# EAGLE design ESP8266 4-relay board 12V power (EAGLE 9.6.2)

## Sheet 1 of 3
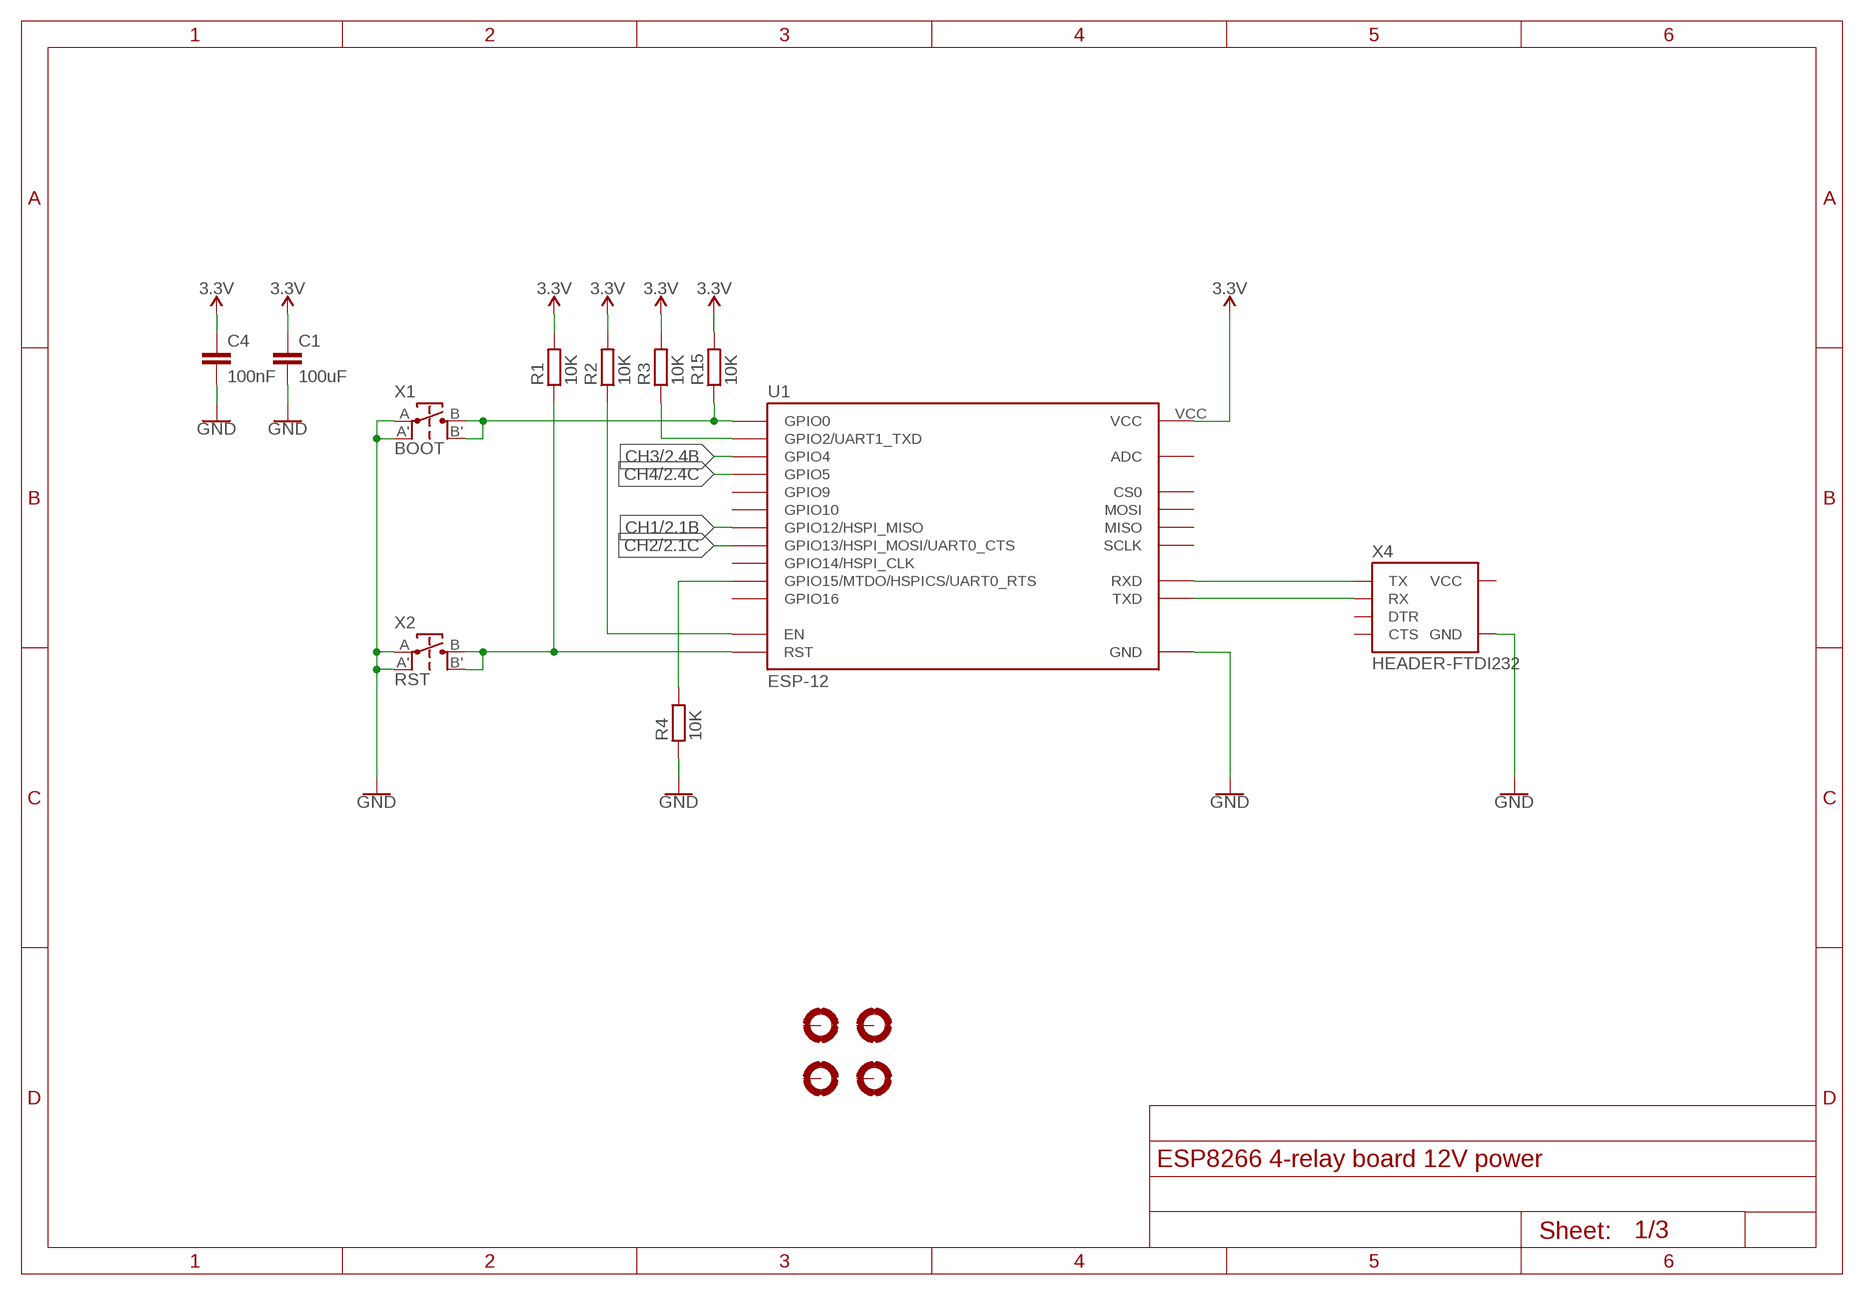
[diagram p0: schematic, sheet 1]

### Parts
C1  100uF  CAPC0603  [C0603]
C4  100nF  CAPC0603  [C0603]
H1  MOUNTHOLE-PAD3.2  [3.2-PAD]
H2  MOUNTHOLE-PAD3.2  [3.2-PAD]
H3  MOUNTHOLE-PAD3.2  [3.2-PAD]
H4  MOUNTHOLE-PAD3.2  [3.2-PAD]
R1  10K  RESISTOR0603  [R0603]
R2  10K  RESISTOR0603  [R0603]
R3  10K  RESISTOR0603  [R0603]
R4  10K  RESISTOR0603  [R0603]
R15  10K  RESISTOR0603  [R0603]
U1  ESP-12  ESP-12E  [ESP-12E]
X1  BOOT  TACT-SWITCHEVQ  [TACT-SWITCH-EVQ]
X2  RST  TACT-SWITCHEVQ  [TACT-SWITCH-EVQ]
X4  HEADER-FTDI232  [FTDI232-1X06]

### Nets
3.3V: C1.1 C4.1 R1.2 R2.2 R3.2 R15.2 U1.VCC ; also sheet 3
CH1: U1.GPIO12(GPIO12/HSPI_MISO) ; also sheet 2
CH2: U1.GPIO13(GPIO13/HSPI_MOSI/UART0_CTS) ; also sheet 2
CH3: U1.GPIO4 ; also sheet 2
CH4: U1.GPIO5 ; also sheet 2
GND: C1.2 C4.2 R4.1 U1.GND X1.A X1.A' X2.A X2.A' X4.GND ; also sheet 2,3
N$7: R4.2 U1.GPIO15(GPIO15/MTDO/HSPICS/UART0_RTS)
N$16: R2.1 U1.EN
N$19: R1.1 U1.RST X2.B X2.B'
N$22: R15.1 U1.GPIO0 X1.B X1.B'
N$24: R3.1 U1.GPIO2(GPIO2/UART1_TXD)
RXD: U1.RXD X4.TX
TXD: U1.TXD X4.RX
Unconnected: H1.B3,2(MOUNT) H2.B3,2(MOUNT) H3.B3,2(MOUNT) H4.B3,2(MOUNT) U1.ADC U1.CS0 U1.GPIO9 U1.GPIO10 U1.GPIO14(GPIO14/HSPI_CLK) U1.GPIO16 U1.MISO U1.MOSI U1.SCLK X4.CTS X4.DTR

## Sheet 2 of 3
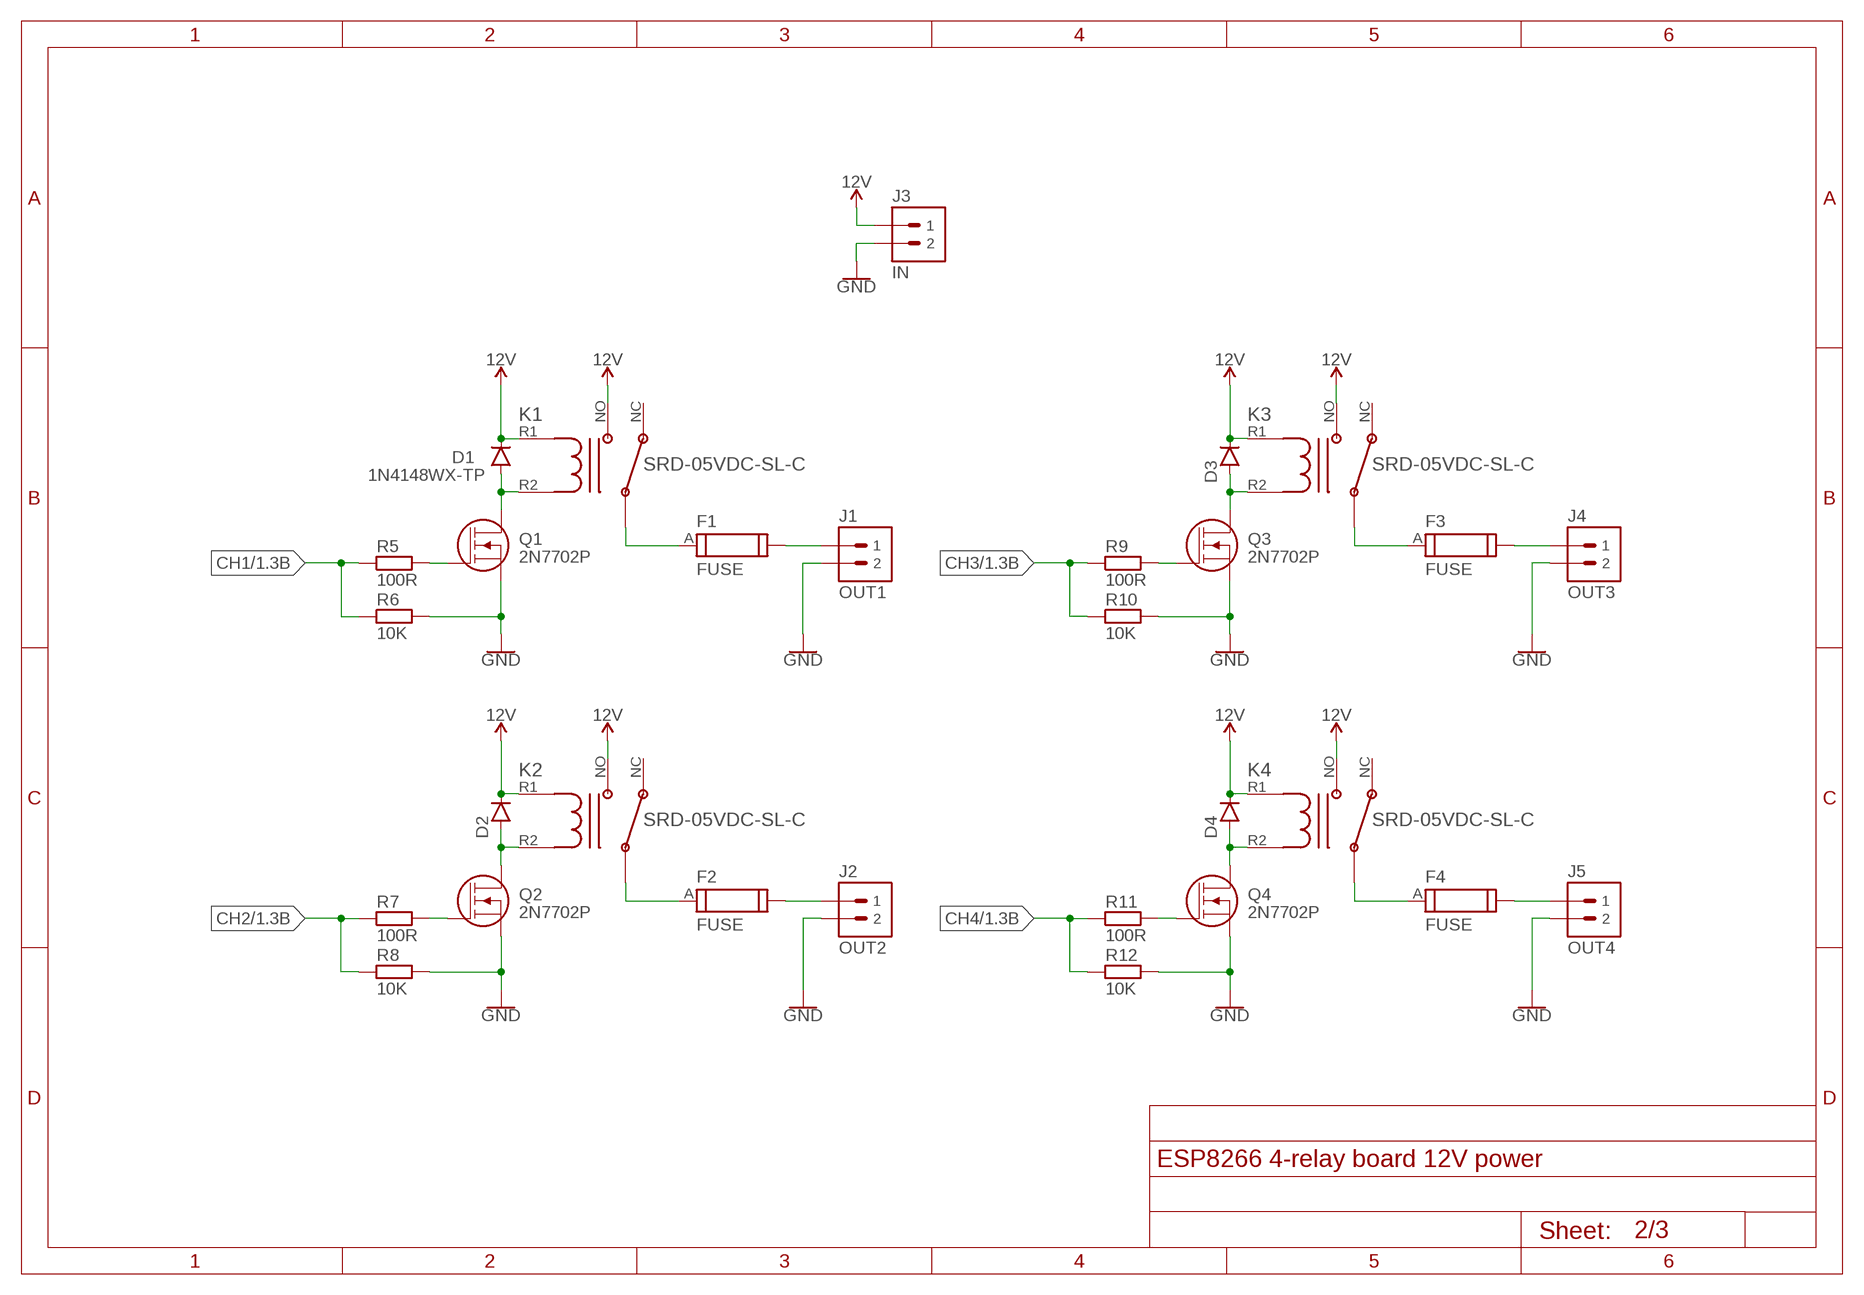
[diagram p1: schematic, sheet 2]

### Parts
D1  1N4148WX-TP  DIODE1N4148WX-TP  [SOD-323]
D2  DIODE1N4148WX-TP  [SOD-323]
D3  DIODE1N4148WX-TP  [SOD-323]
D4  DIODE1N4148WX-TP  [SOD-323]
F1  FUSE  FUSETEAL  [FUSE-TEAL]
F2  FUSE  FUSETEAL  [FUSE-TEAL]
F3  FUSE  FUSETEAL  [FUSE-TEAL]
F4  FUSE  FUSETEAL  [FUSE-TEAL]
J1  OUT1  TERMINAL-1X02-5.08OSTTC022162  [ONSHORE-OSTTC022162]
J2  OUT2  TERMINAL-1X02-5.08OSTTC022162  [ONSHORE-OSTTC022162]
J3  IN  TERMINAL-1X02-5.08OSTTC022162  [ONSHORE-OSTTC022162]
J4  OUT3  TERMINAL-1X02-5.08OSTTC022162  [ONSHORE-OSTTC022162]
J5  OUT4  TERMINAL-1X02-5.08OSTTC022162  [ONSHORE-OSTTC022162]
K1  SRD-05VDC-SL-C  RELAYSRD-05VDC-SL-C  [RELAY-SRD-05VDC-SL-C]
K2  SRD-05VDC-SL-C  RELAYSRD-05VDC-SL-C  [RELAY-SRD-05VDC-SL-C]
K3  SRD-05VDC-SL-C  RELAYSRD-05VDC-SL-C  [RELAY-SRD-05VDC-SL-C]
K4  SRD-05VDC-SL-C  RELAYSRD-05VDC-SL-C  [RELAY-SRD-05VDC-SL-C]
Q1  2N7702P  MOSFET-NCHSOT23-3  [SOT23-3]
Q2  2N7702P  MOSFET-NCHSOT23-3  [SOT23-3]
Q3  2N7702P  MOSFET-NCHSOT23-3  [SOT23-3]
Q4  2N7702P  MOSFET-NCHSOT23-3  [SOT23-3]
R5  100R  RESISTOR0603  [R0603]
R6  10K  RESISTOR0603  [R0603]
R7  100R  RESISTOR0603  [R0603]
R8  10K  RESISTOR0603  [R0603]
R9  100R  RESISTOR0603  [R0603]
R10  10K  RESISTOR0603  [R0603]
R11  100R  RESISTOR0603  [R0603]
R12  10K  RESISTOR0603  [R0603]

### Nets
12V: D1.1(C) D2.1(C) D3.1(C) D4.1(C) J3.1 K1.NO K1.R1 K2.NO K2.R1 K3.NO K3.R1 K4.NO K4.R1 ; also sheet 3
CH1: R5.1 R6.1 ; also sheet 1
CH2: R7.1 R8.1 ; also sheet 1
CH3: R9.1 R10.1 ; also sheet 1
CH4: R11.1 R12.1 ; also sheet 1
GND: J1.2 J2.2 J3.2 J4.2 J5.2 Q1.2(S) Q2.2(S) Q3.2(S) Q4.2(S) R6.2 R8.2 R10.2 R12.2 ; also sheet 1,3
N$1: D1.2(A) K1.R2 Q1.3(D)
N$2: F1.A K1.C
N$3: F1.B J1.1
N$4: Q1.1(G) R5.2
N$8: D2.2(A) K2.R2 Q2.3(D)
N$9: Q2.1(G) R7.2
N$10: F2.A K2.C
N$11: F2.B J2.1
N$12: D3.2(A) K3.R2 Q3.3(D)
N$13: F3.A K3.C
N$14: F3.B J4.1
N$15: Q3.1(G) R9.2
N$17: D4.2(A) K4.R2 Q4.3(D)
N$18: Q4.1(G) R11.2
N$20: F4.A K4.C
N$21: F4.B J5.1
Unconnected: K1.NC K2.NC K3.NC K4.NC

## Sheet 3 of 3
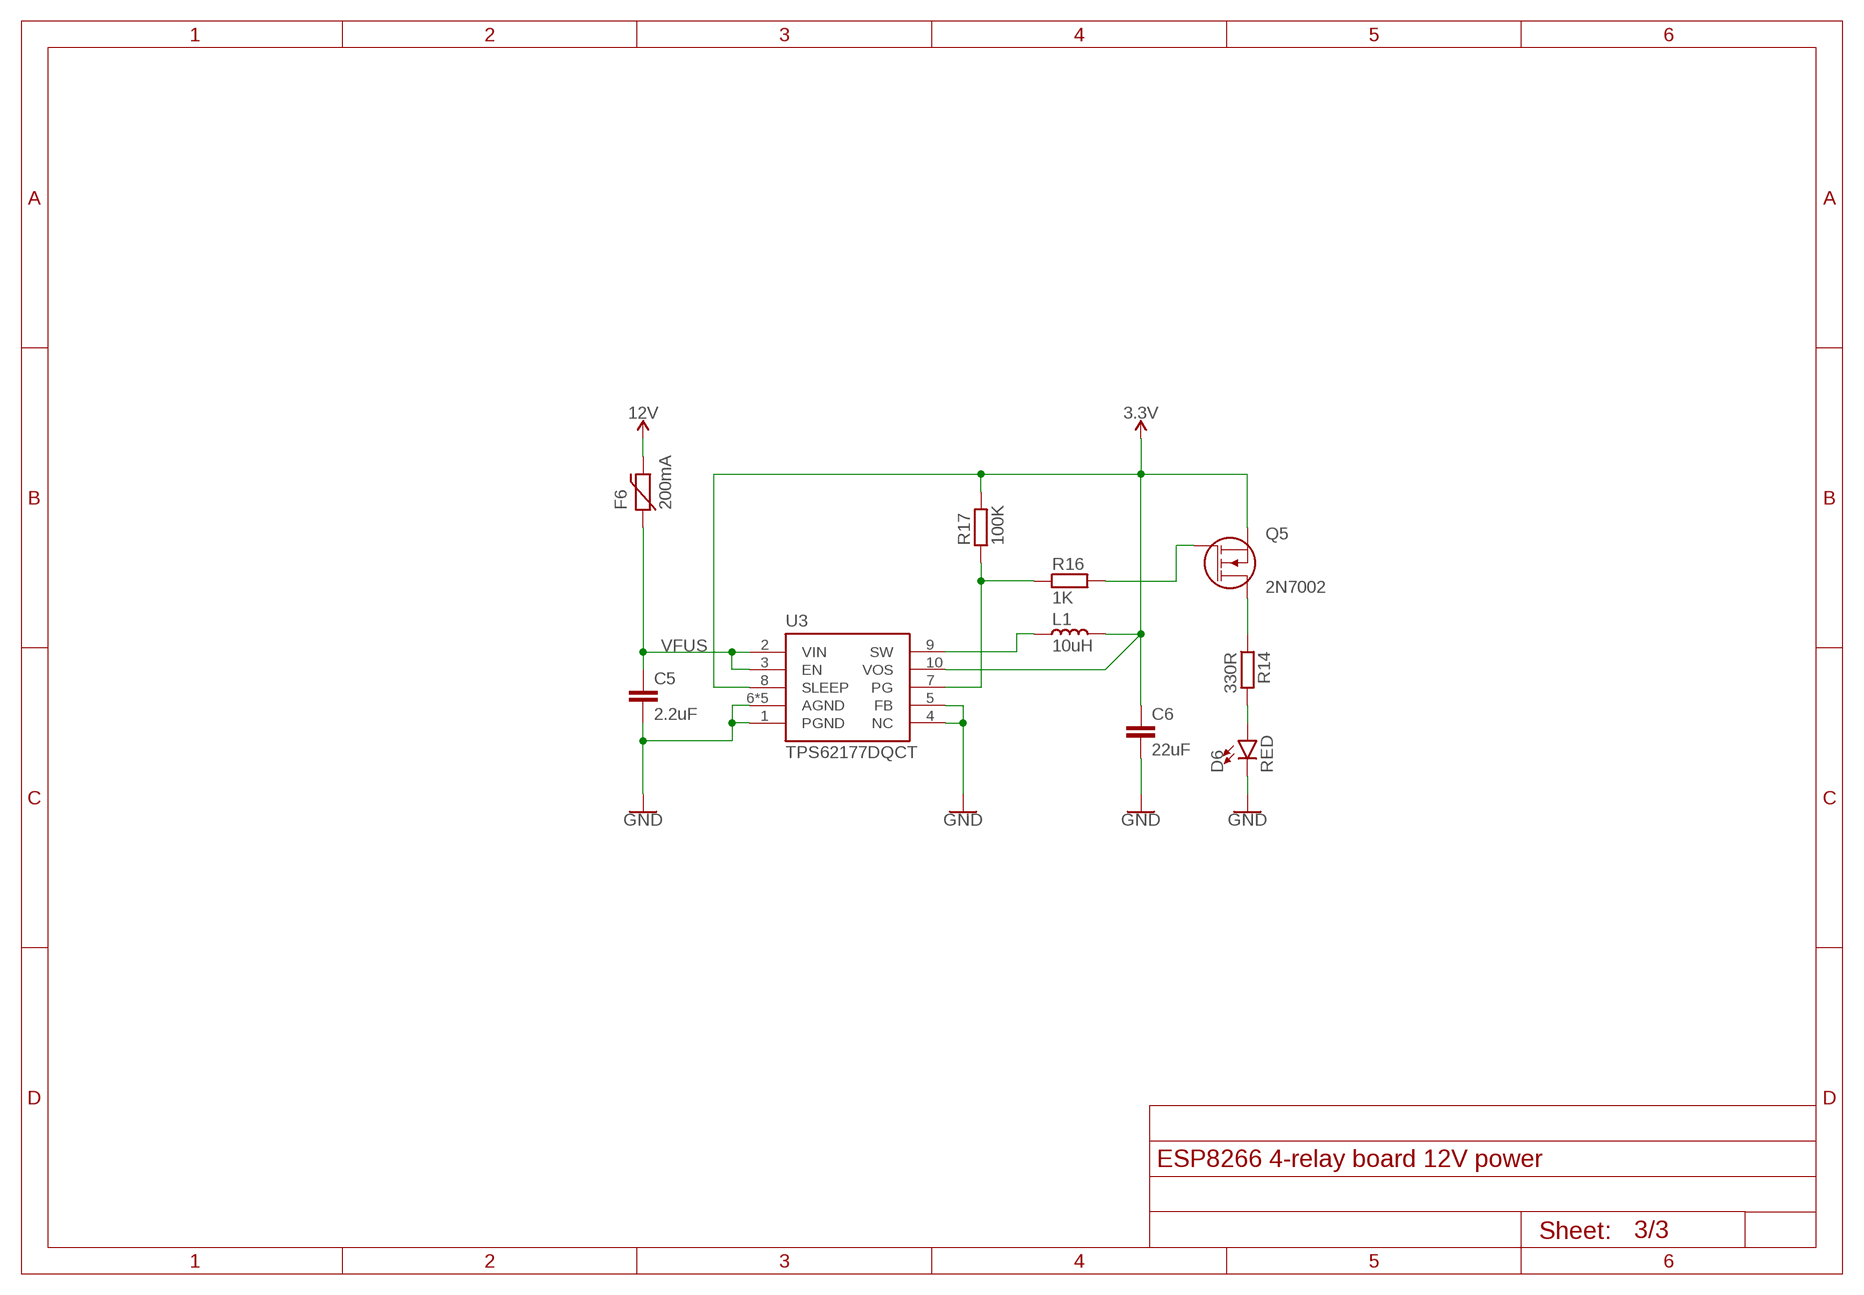
[diagram p2: schematic, sheet 3]

### Parts
C5  2.2uF  CAPC0603  [C0603]
C6  22uF  CAPC0603  [C0603]
D6  RED  LED0603  [LED0603]
F6  200mA  PTC0ZCJ  [PTC-0ZCJ-1206]
L1  10uH  INDUCTORVLS3015E  [TDK-VLS3015E]
Q5  2N7002  MOSFET-NCHSOT23-3  [SOT23-3]
R14  330R  RESISTOR0603  [R0603]
R16  1K  RESISTOR0603  [R0603]
R17  100K  RESISTOR0603  [R0603]
U3  TPS62177DQCT  TI-TPS62177DQCT  [WSON-10]

### Nets
3.3V: C6.1 L1.2 Q5.2(S) R17.2 U3.8(SLEEP) U3.10(VOS) ; also sheet 1
12V: F6.2 ; also sheet 2
GND: C5.2 C6.2 D6.C U3.1(PGND) U3.4(NC) U3.5(FB) U3.6(AGND) U3.11(AGND) U3.P$1(AGND) U3.P$2(AGND) U3.P$3(AGND) ; also sheet 1,2
N$23: D6.A R14.2
N$25: R16.1 R17.1 U3.7(PG)
N$26: Q5.1(G) R16.2
N$27: Q5.3(D) R14.1
SW1: L1.1 U3.9(SW)
VFUS: C5.1 F6.1 U3.2(VIN) U3.3(EN)

## Power pins joined to a net without a drawn wire
VCC: X4.VCC

## Library data of the parts
C1 C4-C6 = M2M-Passives:CAP
D1-D4 = M2M-DiscreteSemi:DIODE
D6 = M2M-LED:LED: LED (Generic) Standard schematic elements and footprints for 5mm, 3mm, 1206, and 0603 sized LEDs. Generic LEDs with no color specified.
F1-F4 = M2M-Power:FUSE
F6 = M2M-Fuse:PTC
H1-H4 = M2M-Holes:MOUNTHOLE-PAD
J1-J5 = M2M-Connectors:TERMINAL-1X02-5.08: https://www.digikey.se/product-detail/sv/on-shore-technology-inc/OSTTC022162/ED2609-ND/614558
K1-K4 = M2M-Switches:RELAY
L1 = M2M-Passives:INDUCTOR
Q1-Q5 = M2M-DiscreteSemi:MOSFET-NCH
R1-R12 R14-R17 = M2M-Passives:RESISTOR
U1 = M2M-Modules:ESP-12E
U3 = M2M-IC:TI-TPS62177DQCT
X1 X2 = M2M-Switches:TACT-SWITCH
X4 = M2M-Connectors:HEADER-FTDI232

## Board
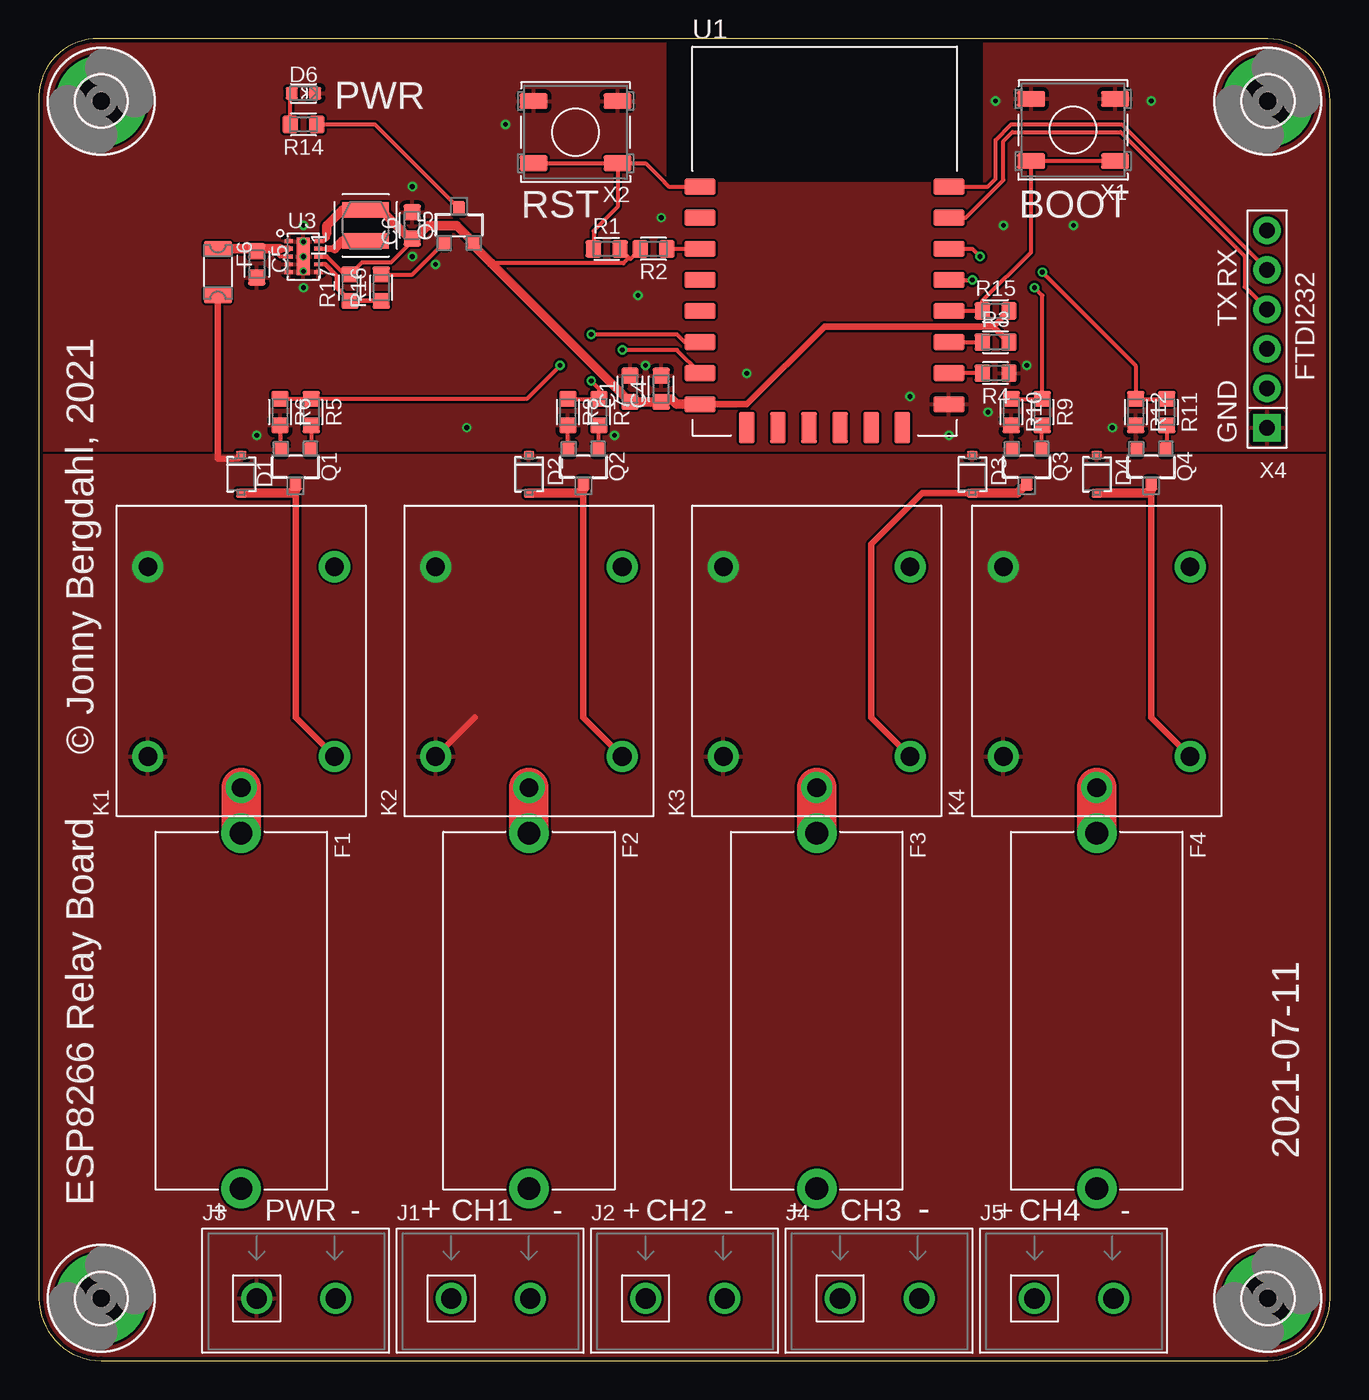
[diagram p3: board, top side]
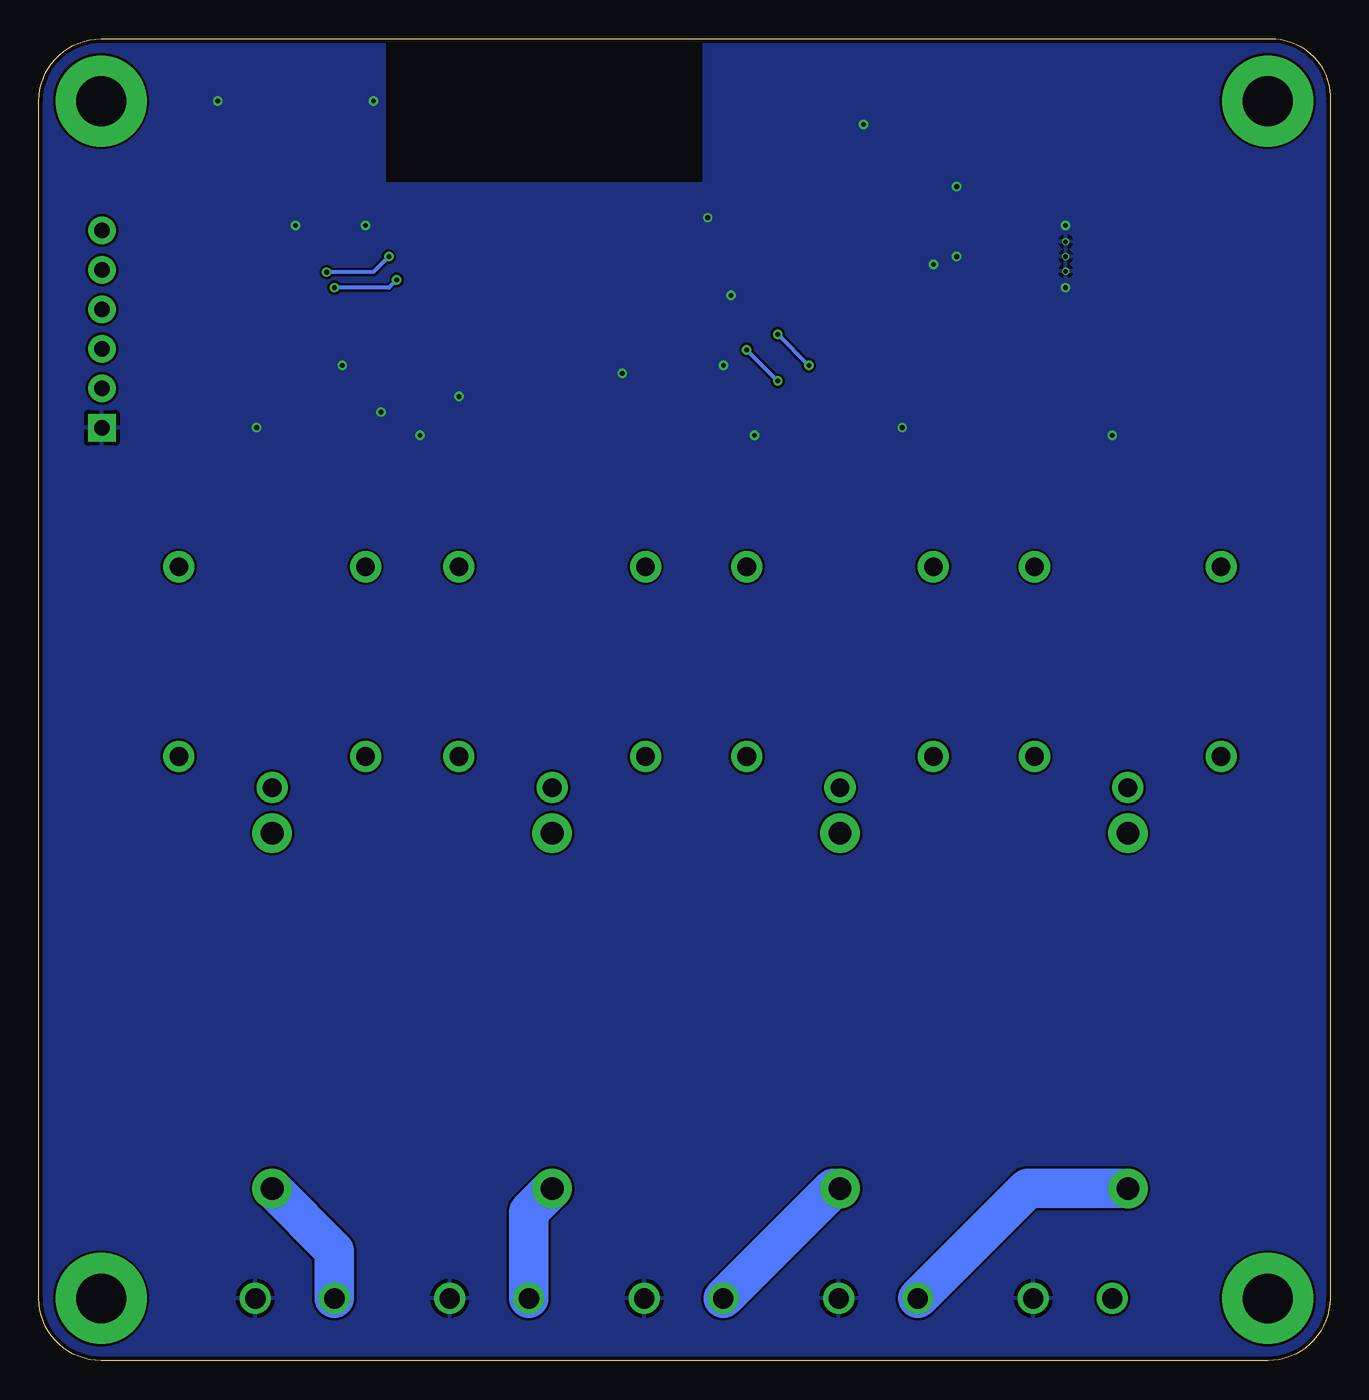
[diagram p4: board, bottom side, seen from below]

Size 83.01 x 85 mm. Coordinates in mm from the lower left corner, seen from the top.
Outline: 83.01,4 83.01,81 arc90 79.01,85 3.51,85 arc90 0.01,81 0.01,4 arc90 4.01,0 79.01,0 arc90 83.01,4
Copper layers (1*16): Top 0.035mm / dielectric 1.5mm / Bottom 0.035mm
Design rules "SeeedStudio_2layer_DRU_no_angle_20140221 *": minimum track width 6mil, minimum drill 0.3mm, track to track 6mil, track to pad 6mil, pad to pad 6mil, via to via 6mil, smd to smd 0mil, copper to edge 10mil, drill to drill 10mil, minimum pad ring 2mil, minimum via ring 6mil, stop-mask expansion 2mil, vias tented up to drill 1000mil, thermal gap 10mil

### Footprints (pad centres in the part's own frame; a part is rotated, then mirrored left to right if it is on the bottom)
C0603 = smd 1 x 1.1: 1 -0.85,0; 2 0.85,0
SOD-323 = smd 0.56 x 0.68: 1 -1.22,0; 2 1.22,0
LED0603 = smd 0.8 x 0.8: A -0.75,0; C 0.75,0
FUSE-TEAL = drill 1.45 pad 2.54: A -11.43,0; B 11.43,0
PTC-0ZCJ-1206 = smd 1 x 1.8: 1 -1.5,0; 2 1.5,0
3.2-PAD = drill 3.2 pad 5.842: B3,2 0,0
ONSHORE-OSTTC022162 = drill 1.3 pad 2: 1 0,0; 2 5.08,0
RELAY-SRD-05VDC-SL-C = drill 1.2 pad 2: C -8.15,0; NC 6.05,-6; NO 6.05,6; R1 -6.15,6; R2 -6.15,-6
TDK-VLS3015E = smd 1 x 3: 1 -1,0; 2 1,0
SOT23-3 = smd 0.8 x 0.9: 1 -0.95,-1.1; 2 0.95,-1.1; 3 0,1.1
R0603 = smd 1 x 1.1: 1 -0.85,0; 2 0.85,0
ESP-12E = smd 2 x 1: ADC -8,1.5; EN -8,-0.5; GND 8,-10.5; GPIO0 8,-4.5; GPIO2 8,-6.5; GPIO4 8,-2.5; GPIO5 8,-0.5; GPIO12 -8,-6.5; GPIO13 -8,-8.5; GPIO14 -8,-4.5; GPIO15 8,-8.5; GPIO16 -8,-2.5; RST -8,3.5; RXD 8,1.5; TXD 8,3.5; VCC -8,-10.5 | smd 1 x 2: CS0 -5,-12; GPIO9 -1,-12; GPIO10 1,-12; MISO -3,-12; MOSI 3,-12; SCLK 5,-12
WSON-10 = smd 0.5 x 0.25: 1 -0.95,1; 2 -0.95,0.5; 3 -0.95,0; 4 -0.95,-0.5; 5 -0.95,-1; 6 0.95,-1; 7 0.95,-0.5; 8 0.95,0; 9 0.95,0.5; 10 0.95,1 | smd 0.84 x 2.4: 11 0,0 | drill 0.3 pad 0.406: P$1 0,0; P$2 0,0.95; P$3 0,-0.95
TACT-SWITCH-EVQ = smd 1.8 x 1: A -2.7,-2; A' 2.7,-2; B -2.7,2; B' 2.7,2
FTDI232-1X06 = drill 1 pad 1.778: CTS 0,3.81; DTR 0,-6.35; RX 0,-3.81; TX 0,-1.27; VCC 0,1.27 | drill 1 pad 1.778 square: GND 0,6.35

### Placement (x,y rotation side)
C1  38.01,62.5 90 top
C4  40.01,62.5 90 top
C5  14.01,70.5 270 top
C6  24.01,73 90 top
D1  13.01,57 270 top
D2  31.51,57 270 top
D3  60.01,57 270 top
D4  68.01,57 270 top
D6  17.01,81.5 0 top
F1  13.01,22.5 270 top
F2  31.51,22.5 270 top
F3  50.01,22.5 270 top
F4  68.01,22.5 270 top
F6  11.51,70 270 top
H1  4.01,4 0 top
H2  79.01,4 0 top
H3  4.01,81 0 top
H4  79.01,81 0 top
J1  26.51,4 0 top
J2  39.01,4 0 top
J3  14.01,4 0 top
J4  51.51,4 0 top
J5  64.01,4 0 top
K1  13.01,45 90 top
K2  31.51,45 90 top
K3  50.01,45 90 top
K4  68.01,45 90 top
L1  21.01,73 90 top
Q1  16.51,57.5 180 top
Q2  35.01,57.5 180 top
Q3  63.51,57.5 180 top
Q4  71.51,57.5 180 top
Q5  27.01,73 0 top
R1  36.51,71.5 0 top
R2  39.51,71.5 180 top
R3  61.51,65.5 0 top
R4  61.51,63.5 180 top
R5  17.51,61 270 top
R6  15.51,61 270 top
R7  36.01,61 270 top
R8  34.01,61 270 top
R9  64.51,61 270 top
R10  62.51,61 270 top
R11  72.51,61 270 top
R12  70.51,61 270 top
R14  17.01,79.5 180 top
R15  61.51,67.5 0 top
R16  22.01,69 90 top
R17  20.01,69 90 top
U1  50.51,72 0 top
U3  17.01,71 0 top
X1  66.49,79.14 180 top
X2  34.51,79 180 top
X4  78.96,66.34 180 top

### Tracks (layer width: path | path; a pad name or v marks a point on that pad's centre or on a via)
3.3V
  Top 0.254: R2.2 38.01,70.85 37.93,70.92 | R1.2 37.93,70.92 | 37.93,70.92 37.58,70.58 29.08,70.58 | 18.51,72.2 18.31,72 U3.10 | U3.8 18.51,71 19.66,69.85 R17.2 20.79,70.63 22.64,70.63 24.01,72 C6.1
  Top 0.406: 61.36,66.5 R3.2 | U1.VCC 45.51,61.5 50.51,66.5 61.36,66.5 | R15.2 61.36,66.5 | 18.51,72.2 18.51,72.5
  Top 0.61: U1.VCC 41.01,61.5 40.66,61.85 C4.1 C1.1 29.08,70.58 27.96,71.7 Q5.2 26.86,73 25.01,73 24.16,72.15 C6.1 23.86,72.15 22.01,74 L1.2 19.51,74 18.51,73 18.51,72.5
  pour Top: 22.51,74.3 22.41,74.4 19.61,74.4
12V
  Top 0.406: K2.R1 28.01,41.35 | F6.2 11.51,58 12.79,58 D1.1
  pour Top (rank 3): 0.01,58.5 85.01,58.5 85.01,0 0.01,0
CH1  (via drill 0.3)
  Top 0.254: v33.51,64 31.36,61.85 R5.1 R6.1 | v35.51,66 41.01,66 41.51,65.5 U1.GPIO12
  Bottom 0.254: v33.51,64 v35.51,66
CH2  (via drill 0.3)
  Top 0.254: R8.1 R7.1 36.01,62.5 v35.51,63 | U1.GPIO13 41.01,65 v37.51,65
  Bottom 0.254: v37.51,65 v35.51,63
CH3  (via drill 0.3)
  Top 0.254: U1.GPIO4 v60.01,69.5 | R10.1 R9.1 64.51,68.5 v64.01,69
  Bottom 0.254: v60.01,69.5 60.51,69 v64.01,69
CH4  (via drill 0.3)
  Top 0.254: U1.GPIO5 60.01,71.5 v60.51,71 | v64.51,70 70.51,64 R12.1 R11.1
  Bottom 0.254: v60.51,71 61.51,70 v64.51,70
GND  (via drill 0.3)
  Top 0.254: Q1.2 15.51,58.65 R6.2 | Q2.2 34.01,58.65 R8.2
  other vias: 45.51,63.5 56.01,62 63.51,64 62.01,73 66.51,73 58.51,59.5 69.01,60 37.01,59.5 14.01,59.5 39.01,64 30.01,79.5 17.01,69 17.01,73 40.01,73.5 38.51,68.5 27.51,60 61.01,61 71.51,81 61.51,81 25.51,70.5 24.01,71 24.01,75.5
  pour Bottom: 0.01,0 0.01,85 85.01,85 85.01,0
  pour Top (rank 2): 0.01,58.5 85.01,58.5 85.01,85 0.01,85
N$1
  Top 0.406: Q1.3 16.51,56 16.51,41.35 K1.R2
  Top 0.61: D1.2 16.29,55.78 16.51,56
N$2
  Top 2.54: K1.C F1.A
N$3
  Bottom 2.54: F1.B 19.44,11.07 J1.1
N$4
  Top 0.254: R5.2 17.51,58.65 Q1.1
N$7
  Top 0.254: R4.2 U1.GPIO15
N$8
  Top 0.406: Q2.3 35.01,56 35.01,41.35 K2.R2
  Top 0.61: D2.2 34.79,55.78 35.01,56
N$9
  Top 0.254: R7.2 35.96,60.1 Q2.1
N$10
  Top 2.54: K2.C F2.A
N$11
  Bottom 2.54: J2.1 31.94,11.07 F2.B
N$12
  Top 0.406: 63.41,56.3 Q3.3 | K3.R2 53.51,41.35 53.51,52.5 56.79,55.78 D3.2
  Top 0.61: D3.2 62.89,55.78 63.41,56.3
N$13
  Top 2.54: K3.C F3.A
N$14
  Bottom 2.54: F3.B 51.51,9.57 J4.1
N$15
  Top 0.254: Q3.1 64.46,60.1 R9.2
N$16
  Top 0.254: R2.1 U1.EN
N$17
  Top 0.406: Q4.3 71.51,56 71.51,41.35 K4.R2
  Top 0.61: D4.2 71.29,55.78 71.51,56
N$18
  Top 0.254: R11.2 72.51,58.65 Q4.1
N$19
  Top 0.254: X2.B' X2.B | U1.RST 40.48,75.5 40.22,75.76 40.22,75.79 39.01,77 X2.B | X2.B 37.21,74.2 35.66,72.65 R1.1
N$20
  Top 2.54: K4.C F4.A
N$21
  Bottom 2.54: J5.1 64.01,7.07 F4.B
N$22
  Top 0.254: U1.GPIO0 R15.1 60.66,68.15 63.79,71.28 63.79,77 | 63.79,77 X1.B' | X1.B 63.93,77.14 63.79,77
N$23
  Top 0.254: R14.2 16.16,81.4 D6.A
N$24
  Top 0.254: U1.GPIO2 R3.1
N$25
  Top 0.254: U3.7 18.23,70.5
  Top 0.305: R16.1 R17.1 19.15,69 19.15,69.74 18.4,70.5 18.23,70.5
N$26
  Top 0.254: R16.2 24.01,69.85 Q5.1
N$27
  Top 0.254: R14.1 21.61,79.5 Q5.3
RXD
  Top 0.254: U1.RXD 59.58,73.5 62.01,75.92 62.01,78.42 62.58,79 69.53,79 77.51,71.03 77.51,69.06 X4.TX
SW1
  Top 0.254: U3.9 18.51,71.5
  Top 0.406: 18.51,71.5 19.01,71.5
  Top 0.61: 19.01,71.5 19.51,72 L1.1
TXD
  Top 0.254: U1.TXD 61.01,75.5 61.51,76 61.51,78.5 62.51,79.5 69.61,79.5 X4.RX
VFUS
  Top 0.254: U3.3 15.51,71 15.01,71.5
  Top 0.406: U3.2 15.51,71.5
  Top 0.61: F6.1 13.86,71.5 | 13.86,71.5 C5.1 | 15.51,71.5 15.01,71.5 13.86,71.5

### Text on the board
tPlace: PWR | RST | BOOT | RX | TX | FTDI232 | GND | © Jonny Bergdahl, 2021 | 2021-07-11 | ESP8266 Relay Board | + | PWR | - | + | CH1 | - | + | CH2 | - | + | CH3 | - | + | CH4 | -